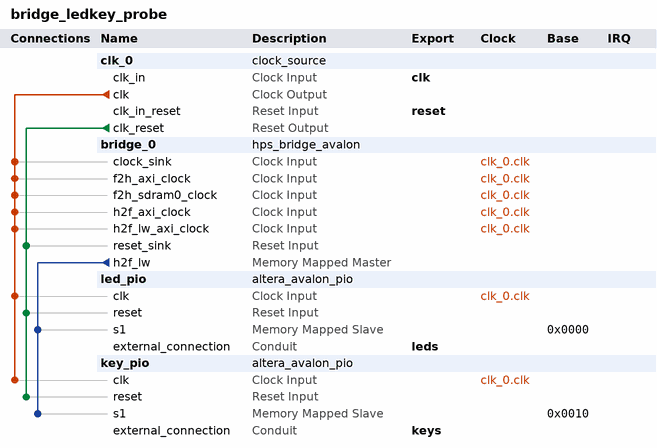
[diagram p0: system contents]
# Platform Designer (Qsys) system bridge_ledkey_probe, Cyclone V 5CSXFC6D6F31C6
# Parameters at their usual value, and those the tool derives, are not listed.
package require -exact qsys 25.1
create_system bridge_ledkey_probe
set_project_property DEVICE_FAMILY {Cyclone V}
set_project_property DEVICE 5CSXFC6D6F31C6

add_instance clk_0 clock_source 25.1
set_instance_parameter_value clk_0 clockFrequency 50000000

add_instance bridge_0 hps_bridge_avalon 25.1
set_instance_parameter_value bridge_0 BONDING_OUT_ENABLED false
set_instance_parameter_value bridge_0 F2H_SDRAM0_CLOCK_FREQ 50000000
set_instance_parameter_value bridge_0 F2H_SDRAM1_CLOCK_FREQ 100
set_instance_parameter_value bridge_0 F2H_SDRAM2_CLOCK_FREQ 100
set_instance_parameter_value bridge_0 F2H_SDRAM3_CLOCK_FREQ 100
set_instance_parameter_value bridge_0 F2H_SDRAM4_CLOCK_FREQ 100
set_instance_parameter_value bridge_0 F2H_SDRAM5_CLOCK_FREQ 100
set_instance_parameter_value bridge_0 F2SDRAM_Type 0
set_instance_parameter_value bridge_0 F2SDRAM_Width 64
set_instance_parameter_value bridge_0 F2S_Width 2
set_instance_parameter_value bridge_0 LWH2F_Enable true
set_instance_parameter_value bridge_0 S2F_Width 2
set_instance_parameter_value bridge_0 quartus_ini_hps_ip_f2sdram_bonding_out true

add_instance led_pio altera_avalon_pio 25.1
set_instance_parameter_value led_pio direction Output
set_instance_parameter_value led_pio width 4

add_instance key_pio altera_avalon_pio 25.1
set_instance_parameter_value key_pio direction Input
set_instance_parameter_value key_pio width 2

# connections
add_connection clk_0.clk bridge_0.clock_sink clock
add_connection clk_0.clk bridge_0.f2h_axi_clock clock
add_connection clk_0.clk bridge_0.f2h_sdram0_clock clock
add_connection clk_0.clk bridge_0.h2f_axi_clock clock
add_connection clk_0.clk bridge_0.h2f_lw_axi_clock clock
add_connection clk_0.clk key_pio.clk clock
add_connection clk_0.clk led_pio.clk clock
add_connection clk_0.clk_reset bridge_0.reset_sink reset
add_connection clk_0.clk_reset key_pio.reset reset
add_connection clk_0.clk_reset led_pio.reset reset
add_connection bridge_0.h2f_lw key_pio.s1 avalon
set_connection_parameter_value bridge_0.h2f_lw/key_pio.s1 baseAddress 0x0010
add_connection bridge_0.h2f_lw led_pio.s1 avalon
set_connection_parameter_value bridge_0.h2f_lw/led_pio.s1 baseAddress 0x0000

# exported interfaces
add_interface clk clock sink
set_interface_property clk EXPORT_OF clk_0.clk_in
add_interface keys conduit end
set_interface_property keys EXPORT_OF key_pio.external_connection
add_interface leds conduit end
set_interface_property leds EXPORT_OF led_pio.external_connection
add_interface reset reset sink
set_interface_property reset EXPORT_OF clk_0.clk_in_reset

set_interconnect_requirement {$system} qsys_mm.clockCrossingAdapter HANDSHAKE
set_interconnect_requirement {$system} qsys_mm.enableEccProtection FALSE
set_interconnect_requirement {$system} qsys_mm.insertDefaultSlave FALSE
set_interconnect_requirement {$system} qsys_mm.maxAdditionalLatency 1

save_system bridge_ledkey_probe.qsys
